# Altium schematic sheet 05_Power_Management.SchDoc
size A; SheetNumber: 4; SheetTotal: 6
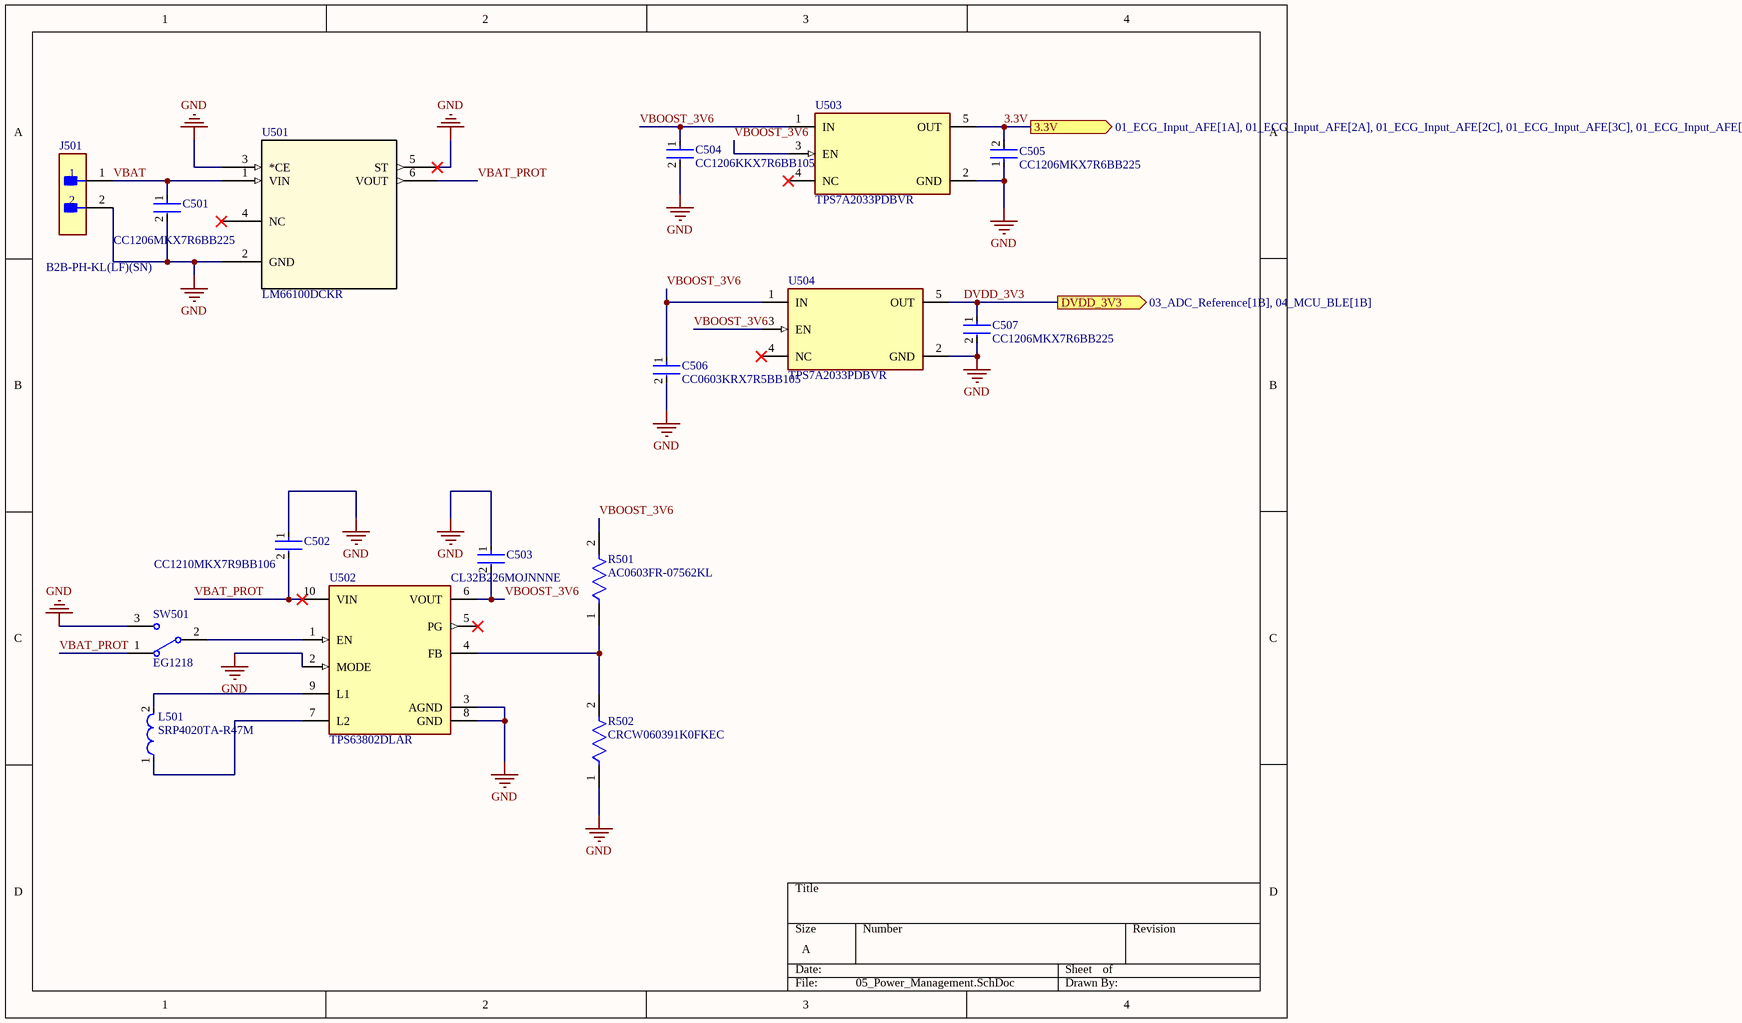
[diagram p0: 05_Power_Management.SchDoc]

## Parts
C501  CC1206MKX7R6BB225  [FP-CC1206-1_25-MFG]
C502  CC1210MKX7R9BB106  [FP-CC1210-GD-MFG]
C503  CL32B226MOJNNNE  [FP-CL32-IPC_A]
C504  CC1206KKX7R6BB105  [FP-CC1206-1_25-MFG]
C505  CC1206MKX7R6BB225  [FP-CC1206-1_25-MFG]
C506  CC0603KRX7R5BB105  [FP-CC0603-DA-MFG]
C507  CC1206MKX7R6BB225  [FP-CC1206-1_25-MFG]
J501  B2B-PH-KL(LF)(SN)  [FP-B2B-PH-KL_LF_SN-MFG]
L501  SRP4020TA-R47M  [FP-SRP4020TA-MFG]
R501  AC0603FR-07562KL  [FP-AC0603-MFG]
R502  CRCW060391K0FKEC  [FP-CRCW0603-e3-MFG]
SW501  EG1218  [ESWI-EG1218_V]
U501  LM66100DCKR  [DCK6_TEX]
U502  TPS63802DLAR  [FP-DLA0010A-MFG]
U503  TPS7A2033PDBVR  [FP-DBV0005A-MFG]
U504  TPS7A2033PDBVR  [FP-DBV0005A-MFG]

## Ports
3.3V (out, see 01_ECG_Input_AFE[1A], 01_ECG_Input_AFE[2A], 01_ECG_Input_AFE[2C], 01_ECG_Input_AFE[3C], 01_ECG_Input_AFE[3D], 03_ADC_Reference[1B], 03_ADC_Reference[3C], 03_ADC_Reference[3D]), DVDD_3V3 (out, see 03_ADC_Reference[1B], 04_MCU_BLE[1B])

## Nets
GND: C501.2 C502.1 C503.1 C504.2 C505.1 C506.2 C507.2 J501.2 R502.1 SW501.3 U501.2(GND) U501.3(*CE) U501.5(ST) U502.2(MODE) U502.3(AGND) U502.8(GND) U503.2(GND) U504.2(GND)
3.3V: C505.2 U503.5(OUT) ; port 3.3V
DVDD_3V3: C507.1 U504.5(OUT) ; port DVDD_3V3
VBAT: C501.1 J501.1 U501.1(VIN)
VBAT_PROT: C502.2 SW501.1 U501.6(VOUT) U502.10(VIN)
VBOOST_3V6: C503.2 C504.1 C506.1 R501.2 U502.6(VOUT) U503.1(IN) U503.3(EN) U504.1(IN) U504.3(EN)
NetL501_1: L501.1 U502.7(L2)
NetL501_2: L501.2 U502.9(L1)
NetR501_1: R501.1 R502.2 U502.4(FB)
NetSW501_2: SW501.2(COM) U502.1(EN)

Not connected (* = marked no-connect by the designer): U501 4(NC)*; U502 5(PG)*; U503 4(NC)*; U504 4(NC)*

## Library data of the parts
C501 C505 C507 = CMP-03422-000380-2: CAP CER 2.2UF 10V X7R 1206; Manufacturer: Yageo; Temperature Coefficient: 15%; Automotive Grade: NA; Tolerance: 0.2; Material: Ceramic; Lead Free: Yes; Temperature Characteristic: X7R; Footprint Url: http://www.yageo.com/exep/pages/download/literatures/UPY-C_GEN_24.pdf; Octopart: https://octopart.com/cc1206mkx7r6bb225-yageo-57080790; Temperature: -55°C to +125°C; Voltage Rating: 10 V; ComponentLink2Description: Datasheet; Device Class L3: Ceramic Capacitors; Manufacturer Part Number: CC1206MKX7R6BB225; Automotive: No; Value: 2.2 uF; Digikey Description: CAP CER 2.2UF 10V X7R 1206; Package: CC1206-1.25; Device Class L2: Capacitors; Category: Cap; Device Class L1: Passive Components; RoHS: TRUE; Height: 1.45mm; ComponentLink2URL: http://www.yageo.com/documents/recent/UPY-NP0X7R_HV_1KV-to-3KV_11.pdf; Capacitance: 2.2 uF; Temperature Range High: +125°C; Temperature Range Low: -55°C
C502 = CMP-03422-001447-1: CAP CER 10UF 50V X7R 1210; Tolerance: 20%; Case/Package: 1210; Max Operating Temperature: 125°C; Case Code (Imperial): 1210; Voltage Rating: 50V; Mount: Surface Mount; Packaging: Tape and Reel; Min Operating Temperature: -55°C; Case Code (Metric): 3225; Capacitance: 10uF; RoHS Compliant: Yes
C503 = CMP-13271-003818-1: Cap Ceramic 22uF 16V X7R ±20% SMD 1210 +125°C Embossed T/R; Mount: Surface Mount; Case/Package: 1210; Case Code (Imperial): 1210; Depth: 2.5mm; Packaging: Tape and Reel; Case Code (Metric): 3225; Package Quantity: 1; Min Operating Temperature: -55°C; Dielectric: X7R; Height: 2.5mm; Length: 3.2mm; Max Operating Temperature: 125°C; Thickness: 0.106inch; Capacitance: 22uF; Width: 0.098inch; Tolerance: 20%; Voltage Rating: 16V; Radiation Hardening: No
C504 = CMP-03422-001171-1: CAP CER 1UF 10V X7R 1206; Manufacturer: Yageo; Material: Ceramic; Tolerance: 0.1; Automotive Grade: NA; Temperature Coefficient: 15%; Category: Cap; Package: CC1206-1.25; Device Class L3: Ceramic Capacitors; Footprint Url: http://www.yageo.com/exep/pages/download/literatures/UPY-C_GEN_24.pdf; Octopart: https://octopart.com/cc1206kkx7r6bb105-yageo-21769912; Temperature Range High: +125°C; Lead Free: Yes; Capacitance: 1 uF; Voltage Rating: 10 V; ComponentLink2Description: Datasheet; ComponentLink2URL: http://www.yageo.com/documents/recent/UPY-NP0X7R_HV_1KV-to-3KV_11.pdf; Height: 1.45mm; Device Class L1: Passive Components; Temperature Range Low: -55°C; Value: 1 uF; Device Class L2: Capacitors; Digikey Description: CAP CER 1UF 10V X7R 1206; RoHS: TRUE; Mouser Description: Multilayer Ceramic Capacitors MLCC - SMD/SMT 1.0uF 10V X7R 10%; Temperature Characteristic: X7R; Automotive: No; Temperature: -55°C to +125°C; Manufacturer Part Number: CC1206KKX7R6BB105
C506 = CMP-03422-000406-1: 0603 1 uF 6.3 V ±10 % Tolerance X7R SMT Multilayer Ceramic Capacitor; Manufacturer: YAGEO; Tolerance: 0.1; Temperature Coefficient: 15%; Capacitance: 1 uF; Value: 1 uF; Voltage Rating: 6.3 V; Temperature Range High: +125°C; Octopart: https://octopart.com/cc0603krx7r5bb105-yageo-11543596; Device Class L2: Capacitors; Package: CC0603-DA; RoHS: TRUE; Digikey Description: 0603 1 uF 6.3 V ±10 % Tolerance X7R SMT Multilayer Ceramic Capacitor; Category: Cap; ComponentLink2URL: http://www.yageo.com/documents/recent/UPY-GPHC_X7R_6.3V-to-50V_18.pdf; Lead Free: Yes; Material: Ceramic; Mouser Description: 0603 1 uF 6.3 V ±10 % Tolerance X7R SMT Multilayer Ceramic Capacitor; Device Class L1: Passive Components; Device Class L3: Ceramic Capacitors; ComponentLink2Description: Datasheet; Automotive: No; Height: 0.9mm; Manufacturer Part Number: CC0603KRX7R5BB105; Voltage: 6.3 V; Temperature: -55°C to +125°C; Temperature Characteristic: X7R; Footprint Url: http://www.yageo.com/exep/pages/download/literatures/UPY-C_GEN_24.pdf; Temperature Range Low: -55°C
J501 = CMP-17439-000682-1: Connector Header, PH Series, 2 Position, 2.00mm, Shrouded Through Hole, Press-Fit, 100V, 32-24 AWG, Solder, Gray; Number of Positions: 2; Pitch: 2mm; Voltage Rating: 100V; Contact Finish - Mating: TIN; Number of Rows: 1; Mount: Through Hole; Flammability Rating: UL94 V-0; Fastening Type: Detent; Contact Shape: Square; Insulation Material: Nylon; Insulation Color: Grey; Contact Material: Brass; Contact Type: Male Pin; Lead Free: Lead Free; Connector Type: Header; Series: PH; Packaging: Bulk; Termination: Press-Fit
L501 = CMP-00059-47300346-1: SRP4020TA-R47M Inductor Power Shielded Wirewound 470nH 20% 100KHz 10Q-Factor Carbonyl Powder 8A 14mOhm DCR 1616 Automotive T/R; DC Resistance (DCR): 14mΩ; Self Resonant Frequency: 120MHz; Q Factor: 10; Max DC Current: 12A; Length: 4.445mm; Weight: 149.997327mg; Max Operating Temperature: 150°C; Case/Package: SMD/SMT; Inductance: 470nH; Current Rating: 8A; Inductance Tolerance: 20%; REACH SVHC: No SVHC; Test Frequency: 100kHz; Schedule B: 8504500000, 8504500000; Packaging: Tape & Reel (TR); Ratings: AEC-Q200; Depth: 4.06mm; Height: 1.8mm; RoHS: Compliant; Core Material: Carbonyl Powder; Height - Seated (Max): 2.0066mm; Series Resistance: 14mΩ; Composition: Wirewound; NexarPartId: 47300346; Number of Pins: 2; Min Operating Temperature: -55°C; Tolerance: 20%; Mount: Surface Mount; Saturation Current: 12A; Shielding: Shielded; RMS Current (Irms): 8A; Width: 4.06mm; Termination: SMD/SMT
R501 = CMP-03412-029819-2: RES 562KΩ 1.00% 0.1W 0603; Tolerance: 1%; Max Power Dissipation: 100mW; Temperature Coefficient: 100ppm/°C; Voltage Rating: 50V; Resistance: 562kR; Number of Terminations: 2; Series: AC; RoHS Compliant: Yes; Length: 0.063inch; Case Code (Metric): 1608; Width: 0.8mm; Features: Moisture Resistant; Termination: SMD/SMT; Max Operating Temperature: 155°C; Weight: 7.1E-05oz; Case/Package: 0603; Min Operating Temperature: -55°C; Height: 0.022inch; Packaging: Tape and Reel; Case Code (Imperial): 0603; Power Rating: 100mW; Resistor Type: Thick Film
R502 = CMP-02407-006807-1: RES Thick Film, 91kΩ, 1%, 0.1W, 100ppm/°C, 0603; Resistance: 91kR; Max Power Dissipation: 100mW; Max Operating Temperature: 155°C; Height: 0.02inch; Features: Automotive AEC-Q200; Temperature Coefficient: 100ppm/°C; Min Operating Temperature: -55°C; Tolerance: 1%; Package Quantity: 20000; Packaging: Tape and Reel; Number of Terminations: 2; Width: 0.033inch; Length: 0.061inch; Composition: Thick Film; Lead Free: Lead Free; Case/Package: 0603
SW501 = CMP-1696-00002-1: Slide Switch, 500 V, -20 to 70 degC, 3-Pin THD, RoHS; Case\Package: SOT-23-5; Output Current: 150 mA; Nominal Output Voltage: 3.3 V; Max Power Dissipation: 250 mW; Min Input Voltage: 4.3 V; Outputs: 1; Max Input Voltage: 8 V; Dropout Voltage: 300 mV; PackageDescription: 3-Pin Through Hole Device, Body 11.6 x 4 mm, Pitch 2.5 mm; ComponentLink1URL: http://www.e-switch.ch/en/; RoHSCompliant: true; Length: 3 mm; ComponentLink1Description: Manufacturer URL; Power Rating: 250 mW; Mount: Surface Mount; Max Operating Temperature: 85 degC; REACH SVHC: No SVHC; Radiation Hardening: No; Height: 1.3 mm; Pins: 5; Max Ouput Current: 150 mA; Output Voltage: 3.3 V; Width: 1.8 mm; Package Quantity: 3000; ComponentLink2URL: https://www.e-switch.com/system/asset/product_line/data_sheet/119/EG.pdf; Min Operating Temperature: -40 degC; ComponentLink2Description: Datasheet; DatasheetVersion: Oct-15; PackageReference: EG1218; Packaging: Tape and Reel
U501 = LM66100DCKR: 1.5-V to 5.5-V, 1.5-A, 0.5-ÂµA IQ ideal diode with integrated FET 6-SC70 -40 to 125; Manufacturer_Name: Texas Instruments; Copyright: Copyright (C) 2025 Ultra Librarian. All rights reserved.; Manufacturer_Part_Number: LM66100DCKR; RefDes: RefDes; Type: Type
U502 = CMP-04918-000005-1: IC POWER MANAGEMENT; Manufacturer: Texas Instruments; Nominal Supply Current: 11uA; Max Junction Temp: +125°C; Max Supply Voltage: 5.5V; Switching Topology: Buck-Boost; Min Supply Voltage: 1.3V; Output Current: 2A; Output Voltage: 1.8-5.2V; Number Of Outputs: 1; Switching Frequency: 1.4/1.6/2.1MHz; Standoff Height: 0mm; Max Duty Cycle: 100%; Output Type: AdjustableProgrammable; Manufacturer Part Number: TPS63802DLAR; ComponentLink2URL: https://www.ti.com/lit/ds/symlink/tps63802.pdf; Digikey Description: IC POWER MANAGEMENT; Octopart: https://octopart.com/tps63802dlar-texas+instruments-97359678; Height: 1mm; Temperature: -40°C to +125°C; Device Class L3: Voltage Regulators - Switching; Lead Free: Yes; Category: IC; Mouser Description: 2-A, high-efficient, 11-µA quiescent current buck-boost converter in QFN/DFN package 10-VSON-HR -40 to 125; ComponentLink2Description: Datasheet; Temperature Range Low: -40°C; Temperature Range High: +125°C; Automotive: No; Device Class L2: Power Management ICs; RoHS: TRUE; Device Class L1: Integrated Circuits (ICs); Package: DLA0010A
U503 U504 = CMP-04917-000300-1: IC REG LINEAR 3.3V 300MA SOT23-5; RoHS Compliant: Yes